# Altium schematic sheet Rele.SchDoc: ИЛ1397ТО1/1
size 410 x 297 mm; ApprovedBy: Стерхов В.Д.; CheckedBy: Стерхов В.Д.; Author: Сергеев Д.А.; CompanyName: ГК "СНАБЖЕНИЕ"; DrawnBy: Сергеев Д.А.; Engineer: Сергеев Д.А.; Organization: ГК "СНАБЖЕНИЕ"; DocumentNumber: ИЛ1397ТО1/1; SheetNumber: 2; SheetTotal: 3
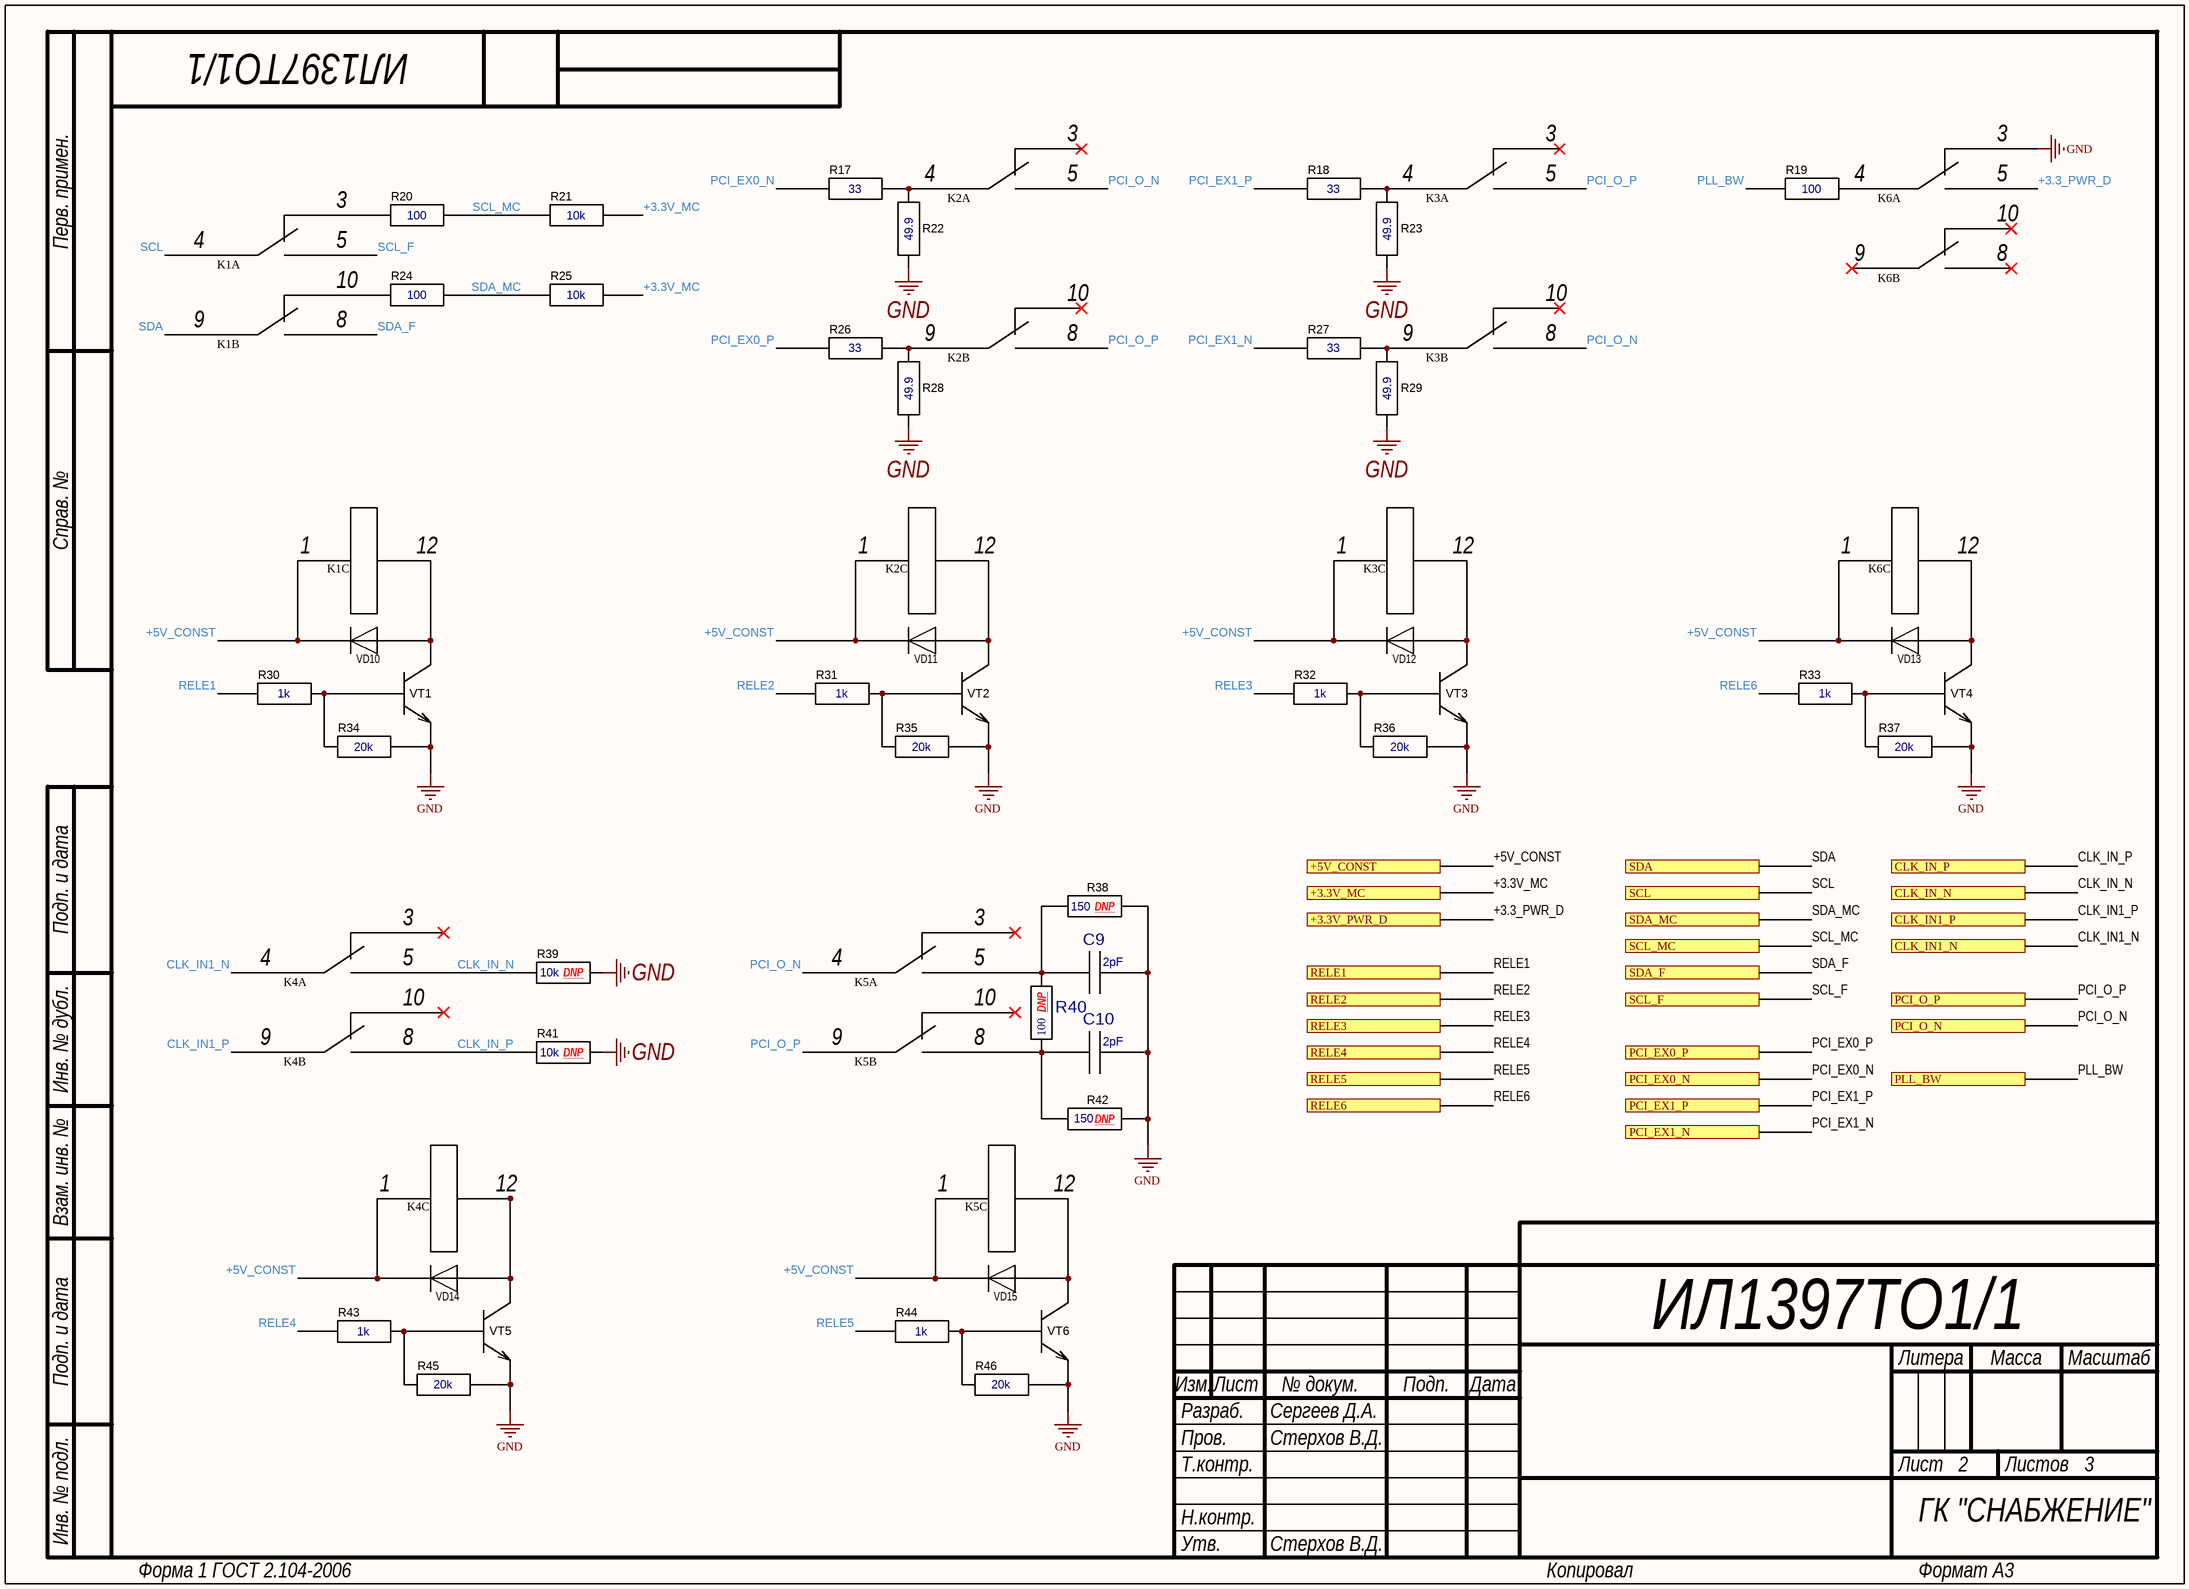
[diagram p0: Rele.SchDoc]

## Parts
C9  2pF  [0805]
C10  2pF  [0805]
K1  V23079A1001B301 TE  [V23079A1001B301]  (value not drawn)  (parts A,B,C of 3)
K2  V23079A1001B301 TE  [V23079A1001B301]  (value not drawn)  (parts A,B,C of 3)
K3  V23079A1001B301 TE  [V23079A1001B301]  (value not drawn)  (parts A,B,C of 3)
K4  V23079A1001B301 TE  [V23079A1001B301]  (value not drawn)  (parts A,B,C of 3)
K5  V23079A1001B301 TE  [V23079A1001B301]  (value not drawn)  (parts A,B,C of 3)
K6  V23079A1001B301 TE  [V23079A1001B301]  (value not drawn)  (parts A,B,C of 3)
R17  33  [0805]
R18  33  [0805]
R19  100  [0805]
R20  100  [0805]
R21  10k  [0805]
R22  49.9  [0805]
R23  49.9  [0805]
R24  100  [0805]
R25  10k  [0805]
R26  33  [0805]
R27  33  [0805]
R28  49.9  [0805]
R29  49.9  [0805]
R30  1k  [0805]
R31  1k  [0805]
R32  1k  [0805]
R33  1k  [0805]
R34  20k  [0805]
R35  20k  [0805]
R36  20k  [0805]
R37  20k  [0805]
R38  150  [0805]
R39  10k  [0805]
R40  100  [0603]
R41  10k  [0805]
R42  150  [0805]
R43  1k  [0805]
R44  1k  [0805]
R45  20k  [0805]
R46  20k  [0805]
VD10  LL4148 NXP  [SOD80C]  (value not drawn)
VD11  LL4148 NXP  [SOD80C]  (value not drawn)
VD12  LL4148 NXP  [SOD80C]  (value not drawn)
VD13  LL4148 NXP  [SOD80C]  (value not drawn)
VD14  LL4148 NXP  [SOD80C]  (value not drawn)
VD15  LL4148 NXP  [SOD80C]  (value not drawn)
VT1  MMBT5551L  [SOT-23]  (value not drawn)
VT2  MMBT5551L  [SOT-23]  (value not drawn)
VT3  MMBT5551L  [SOT-23]  (value not drawn)
VT4  MMBT5551L  [SOT-23]  (value not drawn)
VT5  MMBT5551L  [SOT-23]  (value not drawn)
VT6  MMBT5551L  [SOT-23]  (value not drawn)

## Ports
+3.3V_MC, +3.3V_PWR_D, +5V_CONST, CLK_IN1_N, CLK_IN1_P, CLK_IN_N, CLK_IN_P, PCI_EX0_N, PCI_EX0_P, PCI_EX1_N, PCI_EX1_P, PCI_O_N, PCI_O_P, PLL_BW, RELE1, RELE2, RELE3, RELE4, RELE5, RELE6, SCL, SCL_F, SCL_MC, SDA, SDA_F, SDA_MC

## Nets
GND: C9.2 C10.2 K6.3 R22.1 R23.1 R28.1 R29.1 R34.2 R35.2 R36.2 R37.2 R38.2 R39.2 R41.2 R42.1 R45.2 R46.2 VT1.2(E) VT2.2(E) VT3.2(E) VT4.2(E) VT5.2(E) VT6.2(E)
+3.3_PWR_D: K6.5 ; port +3.3V_PWR_D
+3.3V_MC: R21.2 R25.2 ; port +3.3V_MC
+5V_CONST: K1.1 K2.1 K3.1 K4.1 K5.1 K6.1 VD10.2(K) VD11.2(K) VD12.2(K) VD13.2(K) VD14.2(K) VD15.2(K) ; port +5V_CONST
CLK_IN1_N: K4.4 ; port CLK_IN1_N
CLK_IN1_P: K4.9 ; port CLK_IN1_P
CLK_IN_N: K4.5 R39.1 ; port CLK_IN_N
CLK_IN_P: K4.8 R41.1 ; port CLK_IN_P
PCI_EX0_N: R17.1 ; port PCI_EX0_N
PCI_EX0_P: R26.1 ; port PCI_EX0_P
PCI_EX1_N: R27.1 ; port PCI_EX1_N
PCI_EX1_P: R18.1 ; port PCI_EX1_P
PCI_O_N: K2.5 K3.8 K5.4 ; port PCI_O_N
PCI_O_P: K2.8 K3.5 K5.9 ; port PCI_O_P
PLL_BW: R19.1 ; port PLL_BW
RELE1: R30.1 ; port RELE1
RELE2: R31.1 ; port RELE2
RELE3: R32.1 ; port RELE3
RELE4: R43.1 ; port RELE4
RELE5: R44.1 ; port RELE5
RELE6: R33.1 ; port RELE6
SCL: K1.4 ; port SCL
SCL_F: K1.5 ; port SCL_F
SCL_MC: R20.2 R21.1 ; port SCL_MC
SDA: K1.9 ; port SDA
SDA_F: K1.8 ; port SDA_F
SDA_MC: R24.2 R25.1 ; port SDA_MC
NetC9_1: C9.1 K5.5 R38.1 R40.2
NetC10_1: C10.1 K5.8 R40.1 R42.2
NetK1_3: K1.3 R20.1
NetK1_10: K1.10 R24.1
NetK1_12: K1.12 VD10.1(A) VT1.3(K)
NetK2_4: K2.4 R17.2 R22.2
NetK2_9: K2.9 R26.2 R28.2
NetK2_12: K2.12 VD11.1(A) VT2.3(K)
NetK3_4: K3.4 R18.2 R23.2
NetK3_9: K3.9 R27.2 R29.2
NetK3_12: K3.12 VD12.1(A) VT3.3(K)
NetK4_12: K4.12 VD14.1(A) VT5.3(K)
NetK5_12: K5.12 VD15.1(A) VT6.3(K)
NetK6_4: K6.4 R19.2
NetK6_12: K6.12 VD13.1(A) VT4.3(K)
NetR30_2: R30.2 R34.1 VT1.1(B)
NetR31_2: R31.2 R35.1 VT2.1(B)
NetR32_2: R32.2 R36.1 VT3.1(B)
NetR33_2: R33.2 R37.1 VT4.1(B)
NetR43_2: R43.2 R45.1 VT5.1(B)
NetR44_2: R44.2 R46.1 VT6.1(B)

Not connected (* = marked no-connect by the designer): K2 3* 10*; K3 3* 10*; K4 3* 10*; K5 3* 10*; K6 8* 9* 10*

## Notes on the sheet
- (near R38) DNP
- (near R39) DNP
- (near R40) DNP
- (near R41) DNP
- (near R42) DNP
- Перв. примен.
- Справ. №
- Подп. и дата
- Инв. № дубл.
- Взам. инв. №
- Разраб.
- Изм.
- Лист
- № докум.
- Подп.
- Дата
- Литера
- Масса
- Масштаб
- Пров.
- Т.контр.
- Листов
- Инв. № подл.
- Н.контр.
- Утв.
- Форма 1 ГОСТ 2.104-2006
- Копировал
- Формат А3

## Library data of the parts
C9 C10 = C0805: ComponentHeigt: 1.3; Firme: AVX; Leadform: SMD; KIND: Конденсатор; ClassName: *; Component Link: *; ComponentWeigt: *; Packaging: 0805; NN: *; Value: *
R17-R39 R41-R46 = R0805 Yageo: ComponentHeigt: 0.6; Firme: Yageo; Leadform: SMD; Kind: Резистор; ClassName: *; ComponentWeigt: *; Component Link: *; Packaging: 0805; NN: *; Value: *
R40 = R0603 Yageo: ComponentHeigt: 0.5; Firme: Yageo; Leadform: SMD; Kind: Резистор; ClassName: *; Component Link: *; Packaging: 0402; NN: *
VD10-VD15 = LL4148 NXP: ComponentHeigt: 1.6; Leadform: SMD; NN: 24009301; KIND: Диод LL4148 NXP; Component Link: http://www.nxp.com; Packaging: SOD-80C; ClassName: *; Firme: NXP
VT1-VT6 = MMBT5551L: ComponentHeigt: 1.1; Firme: ONS; Leadform: SMD; NN: 24007468; KIND: Транзистор MMBT5551L*G ONS; ClassName: *; ComponentWeigt: *; Packaging: SOT-23